# Altium schematic sheet Whisper_Ports.SchDoc
size A4; SheetNumber: 4; SheetTotal: 4
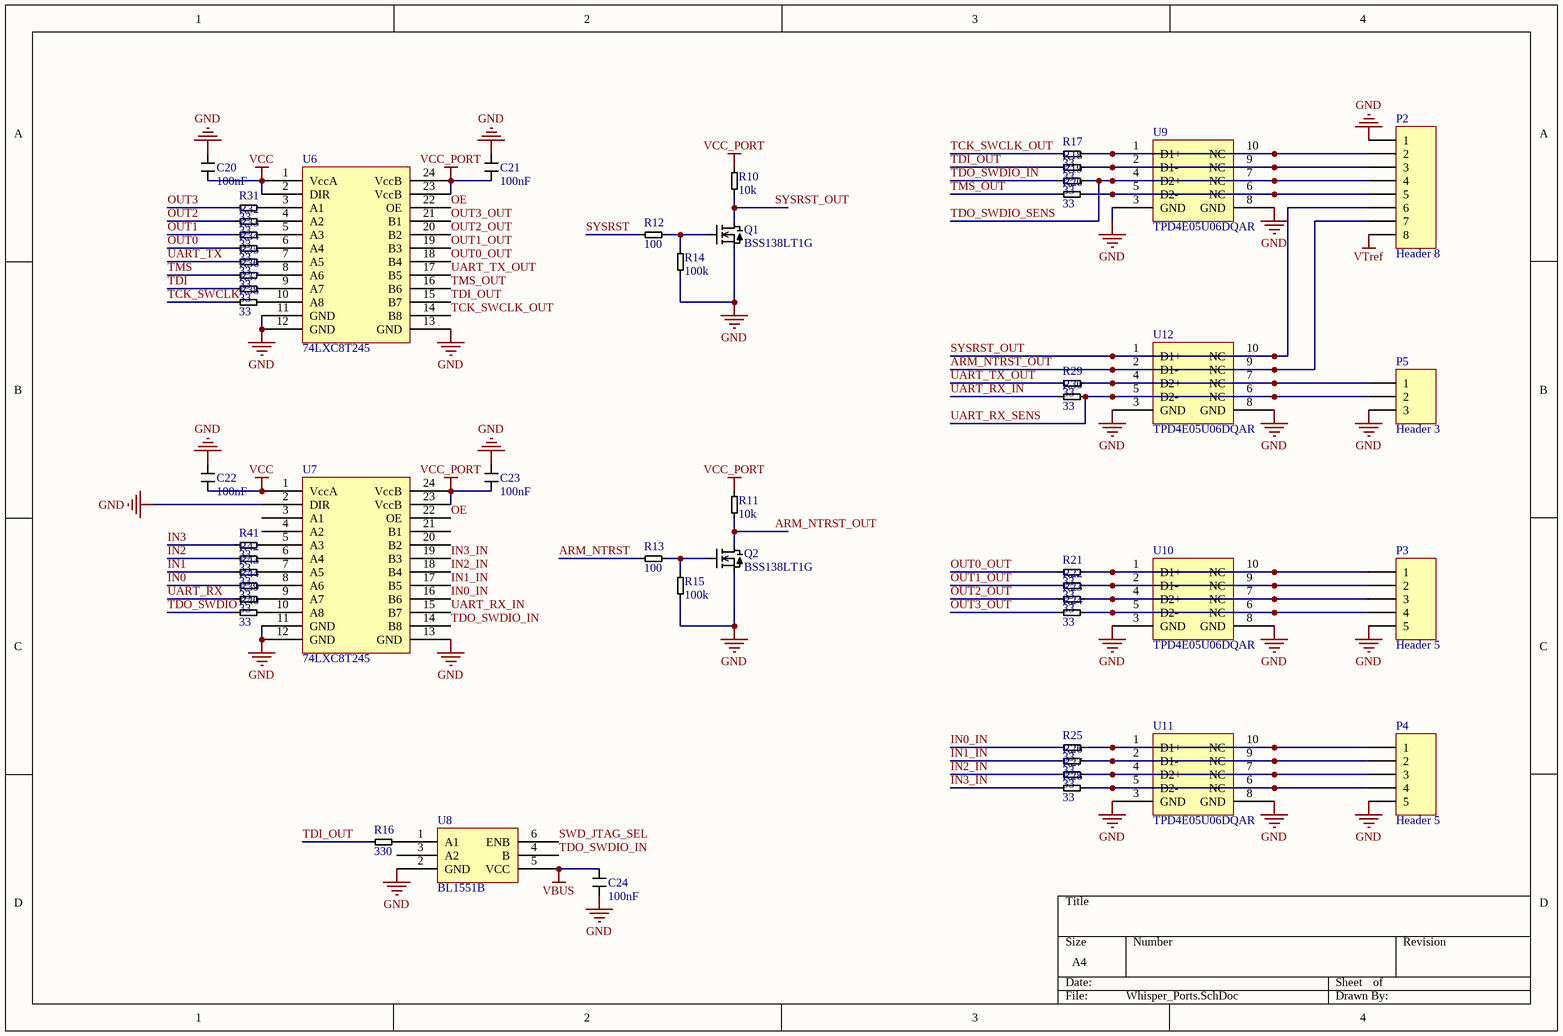
[diagram p0: Whisper_Ports.SchDoc]

## Parts
C20  100nF  [0603-Cap]
C21  100nF  [0603-Cap]
C22  100nF  [0603-Cap]
C23  100nF  [0603-Cap]
C24  100nF  [0603-Cap]
P2  Header 8  [HDR1X8]
P3  Header 5  [HDR1X5]
P4  Header 5  [HDR1X5]
P5  Header 3  [HDR1X3]
Q1  BSS138LT1G  [SOT23]
Q2  BSS138LT1G  [SOT23]
R10  10k  [0603]
R11  10k  [0603]
R12  100  [0603]
R13  100  [0603]
R14  100k  [0603]
R15  100k  [0603]
R16  330  [0603]
R17  33  [0603]
R18  33  [0603]
R19  33  [0603]
R20  33  [0603]
R21  33  [0603]
R22  33  [0603]
R23  33  [0603]
R24  33  [0603]
R25  33  [0603]
R26  33  [0603]
R27  33  [0603]
R28  33  [0603]
R29  33  [0603]
R30  33  [0603]
R31  33  [0603]
R32  33  [0603]
R33  33  [0603]
R34  33  [0603]
R35  33  [0603]
R36  33  [0603]
R37  33  [0603]
R38  33  [0603]
R39  33  [0603]
R40  33  [0603]
R41  33  [0603]
R42  33  [0603]
R43  33  [0603]
R44  33  [0603]
U6  74LXC8T245  [TSSOP-24]
U7  74LXC8T245  [TSSOP-24]
U8  BL1551B  [SC70]
U9  TPD4E05U06DQAR  [SON-10-DQA]
U10  TPD4E05U06DQAR  [SON-10-DQA]
U11  TPD4E05U06DQAR  [SON-10-DQA]
U12  TPD4E05U06DQAR  [SON-10-DQA]

## Nets
GND: C20.1 C21.2 C22.1 C23.2 C24.2 P2.1 P3.5 P4.5 P5.3 Q1.2(S) Q2.2(S) R14.1 R15.1 U6.11(GND) U6.12(GND) U6.13(GND) U7.2(DIR) U7.11(GND) U7.12(GND) U7.13(GND) U8.2(GND) U9.3(GND) U9.8(GND) U10.3(GND) U10.8(GND) U11.3(GND) U11.8(GND) U12.3(GND) U12.8(GND)
VBUS: C24.1 U8.5(VCC)
VCC: C20.2 C22.2 U6.1(VccA) U6.2(DIR) U7.1(VccA)
VCC_PORT: C21.1 C23.1 R10.2 R11.2 U6.23(VccB) U6.24(VccB) U7.23(VccB) U7.24(VccB)
VTref: P2.8
ARM_NTRST: R13.1
ARM_NTRST_OUT: P2.7 Q2.3(D) R11.1 U12.2(D1-) U12.9(NC)
IN0: R44.1
IN0_IN: R25.1 U7.16(B6)
IN1: R43.1
IN1_IN: R26.1 U7.17(B5)
IN2: R42.1
IN2_IN: R27.1 U7.18(B4)
IN3: R41.1
IN3_IN: R28.1 U7.19(B3)
OE: U6.22(OE) U7.22(OE)
OUT0: R34.1
OUT0_OUT: R21.1 U6.18(B4)
OUT1: R33.1
OUT1_OUT: R22.1 U6.19(B3)
OUT2: R32.1
OUT2_OUT: R23.1 U6.20(B2)
OUT3: R31.1
OUT3_OUT: R24.1 U6.21(B1)
SWD_JTAG_SEL: U8.6(ENB)
SYSRST: R12.1
SYSRST_OUT: P2.6 Q1.3(D) R10.1 U12.1(D1+) U12.10(NC)
TCK_SWCLK: R38.1
TCK_SWCLK_OUT: R17.1 U6.14(B8)
TDI: R37.1
TDI_OUT: R16.1 R18.1 U6.15(B7)
TDO_SWDIO: R40.1
TDO_SWDIO_IN: R19.1 U7.14(B8) U8.4(B)
TDO_SWDIO_SENS: P2.4 R19.2 U9.4(D2+) U9.7(NC)
TMS: R36.1
TMS_OUT: R20.1 U6.16(B6)
UART_RX: R39.1
UART_RX_IN: R30.1 U7.15(B7)
UART_RX_SENS: P5.2 R30.2 U12.5(D2-) U12.6(NC)
UART_TX: R35.1
UART_TX_OUT: R29.1 U6.17(B5)
NetP2_2: P2.2 R17.2 U9.1(D1+) U9.10(NC)
NetP2_3: P2.3 R18.2 U9.2(D1-) U9.9(NC)
NetP2_5: P2.5 R20.2 U9.5(D2-) U9.6(NC)
NetP3_1: P3.1 R21.2 U10.1(D1+) U10.10(NC)
NetP3_2: P3.2 R22.2 U10.2(D1-) U10.9(NC)
NetP3_3: P3.3 R23.2 U10.4(D2+) U10.7(NC)
NetP3_4: P3.4 R24.2 U10.5(D2-) U10.6(NC)
NetP4_1: P4.1 R25.2 U11.1(D1+) U11.10(NC)
NetP4_2: P4.2 R26.2 U11.2(D1-) U11.9(NC)
NetP4_3: P4.3 R27.2 U11.4(D2+) U11.7(NC)
NetP4_4: P4.4 R28.2 U11.5(D2-) U11.6(NC)
NetP5_1: P5.1 R29.2 U12.4(D2+) U12.7(NC)
NetQ1_1: Q1.1(G) R12.2 R14.2
NetQ2_1: Q2.1(G) R13.2 R15.2
NetR16_2: R16.2 U8.1(A1)
NetR31_2: R31.2 U6.3(A1)
NetR32_2: R32.2 U6.4(A2)
NetR33_2: R33.2 U6.5(A3)
NetR34_2: R34.2 U6.6(A4)
NetR35_2: R35.2 U6.7(A5)
NetR36_2: R36.2 U6.8(A6)
NetR37_2: R37.2 U6.9(A7)
NetR38_2: R38.2 U6.10(A8)
NetR39_2: R39.2 U7.9(A7)
NetR40_2: R40.2 U7.10(A8)
NetR41_2: R41.2 U7.5(A3)
NetR42_2: R42.2 U7.6(A4)
NetR43_2: R43.2 U7.7(A5)
NetR44_2: R44.2 U7.8(A6)

Not connected (* = marked no-connect by the designer): U7 3(A1) 4(A2) 20(B2) 21(B1); U8 3(A2)

## Library data of the parts
C20-C24 = Cap
P2 = Header 8: Header, 8-Pin; LatestRevisionDate: 17-Jul-2002; LatestRevisionNote: Re-released for DXP Platform.; Publisher: Altium Limited
P3 P4 = Header 5: Header, 5-Pin; LatestRevisionDate: 17-Jul-2002; LatestRevisionNote: Re-released for DXP Platform.; Publisher: Altium Limited
P5 = Header 3: Header, 3-Pin; LatestRevisionDate: 17-Jul-2002; LatestRevisionNote: Re-released for DXP Platform.; Publisher: Altium Limited
Q1 Q2 = NMOS-D
R10-R44 = Res
U9-U12 = TPD4E